# Altium project LED_grow_panel.PrjPcb
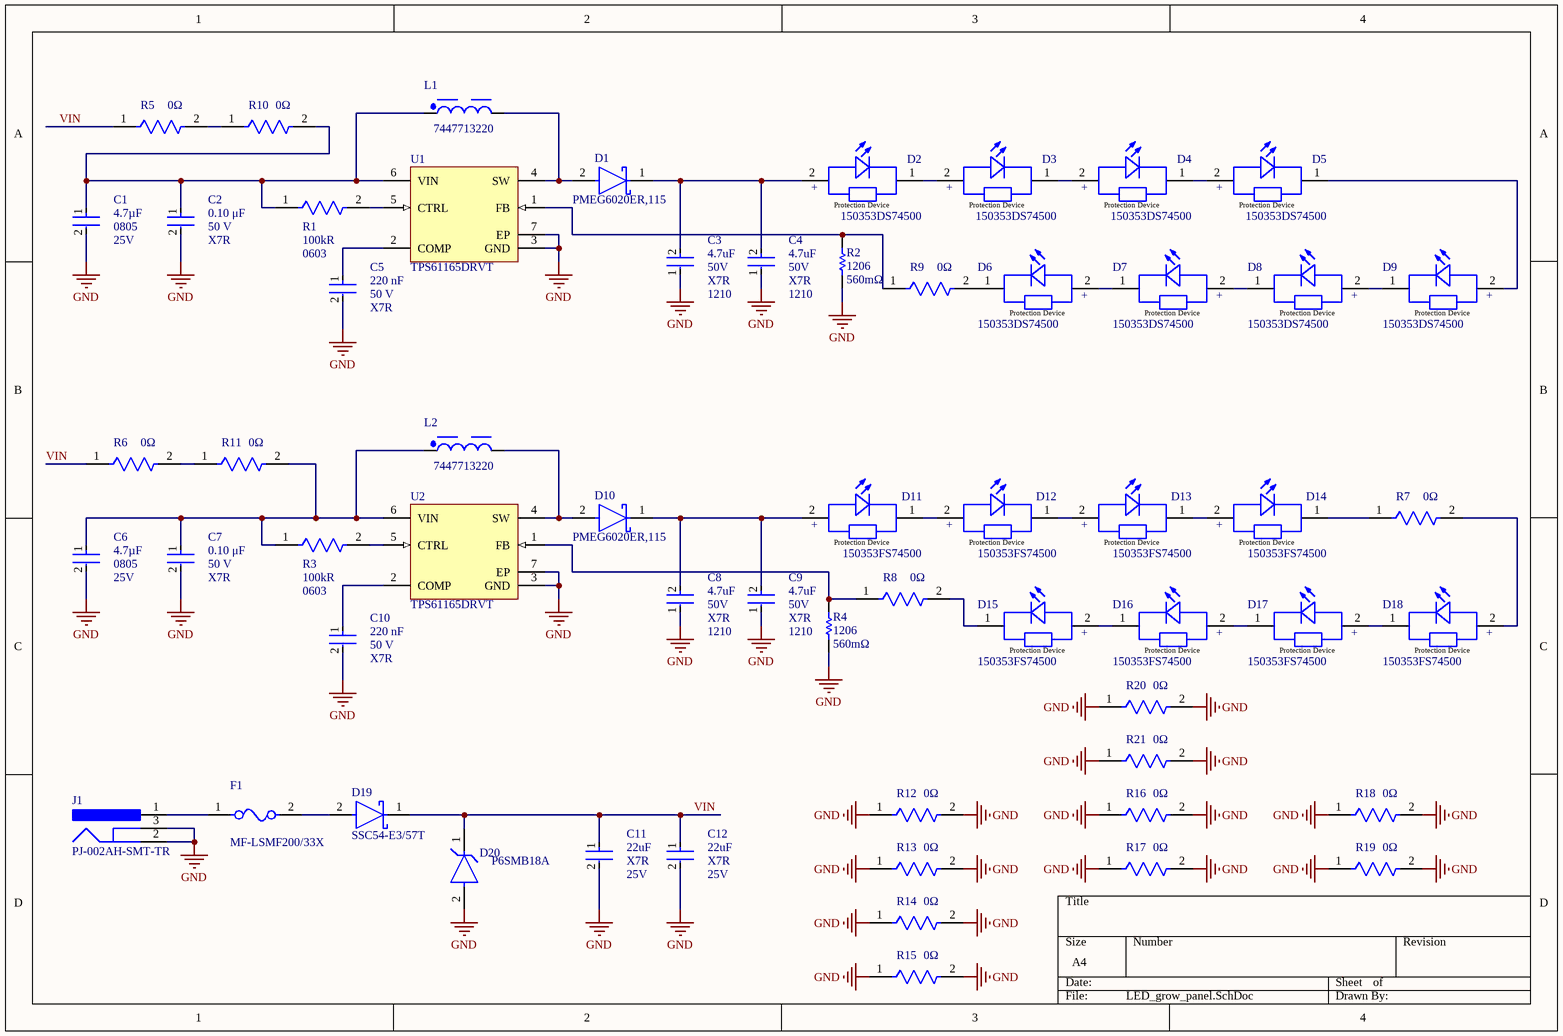
[diagram p0: LED_grow_panel.SchDoc]
1 sheet, 59 parts. Net scope: global (net labels, ports and power ports of the same name join across sheets).
Board file: LED_grow_panel.PcbDoc

## Sheet LED_grow_panel.SchDoc
size A4; SheetNumber: 1; SheetTotal: 1

### Parts
C1  value 4.7µF  Case/Package: 0805  Voltage Rating: 25V  [FP-GRM21B-0_2-e0_2_0_7-IPC_B]  (hidden comment: GRM21BZ71E475KE15L)
C2  Voltage Rating: 50 V  Capacitance: 0.10 μF  Temperature Characteristic: X7R  [FP-C0603C-CF-IPC_B]  (hidden comment: C0603C104K5RACTU)
C3  Capacitance: 4.7uF  Case Code (Imperial): 1210  Dielectric: X7R  Voltage Rating (DC): 50V  [FP-GCM32E-0_3-IPC_B]  (hidden comment: GCM32ER71H475KA55K)
C4  Capacitance: 4.7uF  Case Code (Imperial): 1210  Dielectric: X7R  Voltage Rating (DC): 50V  [FP-GCM32E-0_3-IPC_B]  (hidden comment: GCM32ER71H475KA55K)
C5  value 220 nF  Voltage: 50 V  Temperature Characteristic: X7R  [FP-CC0603-DA-IPC_B]  (hidden comment: CC0603KRX7R9BB224)
C6  value 4.7µF  Case/Package: 0805  Voltage Rating: 25V  [FP-GRM21B-0_2-e0_2_0_7-IPC_B]  (hidden comment: GRM21BZ71E475KE15L)
C7  Voltage Rating: 50 V  Capacitance: 0.10 μF  Temperature Characteristic: X7R  [FP-C0603C-CF-IPC_B]  (hidden comment: C0603C104K5RACTU)
C8  Capacitance: 4.7uF  Case Code (Imperial): 1210  Dielectric: X7R  Voltage Rating (DC): 50V  [FP-GCM32E-0_3-IPC_B]  (hidden comment: GCM32ER71H475KA55K)
C9  Capacitance: 4.7uF  Case Code (Imperial): 1210  Dielectric: X7R  Voltage Rating (DC): 50V  [FP-GCM32E-0_3-IPC_B]  (hidden comment: GCM32ER71H475KA55K)
C10  value 220 nF  Voltage: 50 V  Temperature Characteristic: X7R  [FP-CC0603-DA-IPC_B]  (hidden comment: CC0603KRX7R9BB224)
C11  value 22uF  Temperature Characteristic: X7R  Voltage Rating: 25V  [FP-C1210C226K3RACTU-IPC_B]  (hidden comment: C1210C226K3RACTU)
C12  value 22uF  Temperature Characteristic: X7R  Voltage Rating: 25V  [FP-C1210C226K3RACTU-IPC_B]  (hidden comment: C1210C226K3RACTU)
D1  PMEG6020ER,115  [FP-SOD123W-MFG]
D2  150353DS74500  [WL-SMDC_3535]
D3  150353DS74500  [WL-SMDC_3535]
D4  150353DS74500  [WL-SMDC_3535]
D5  150353DS74500  [WL-SMDC_3535]
D6  150353DS74500  [WL-SMDC_3535]
D7  150353DS74500  [WL-SMDC_3535]
D8  150353DS74500  [WL-SMDC_3535]
D9  150353DS74500  [WL-SMDC_3535]
D10  PMEG6020ER,115  [FP-SOD123W-MFG]
D11  150353FS74500  [WL-SMDC_3535]
D12  150353FS74500  [WL-SMDC_3535]
D13  150353FS74500  [WL-SMDC_3535]
D14  150353FS74500  [WL-SMDC_3535]
D15  150353FS74500  [WL-SMDC_3535]
D16  150353FS74500  [WL-SMDC_3535]
D17  150353FS74500  [WL-SMDC_3535]
D18  150353FS74500  [WL-SMDC_3535]
D19  SSC54-E3/57T  [FP-95402-MFG]
D20  P6SMB18A  [FP-P6SMB-MFG]
F1  MF-LSMF200/33X  [FP-MF-LSMF-MFG]
J1  PJ-002AH-SMT-TR  [CUI-PJ-002AH-4_V]
L1  7447713220  [WE-PD_1030P]
L2  7447713220  [WE-PD_1030P]
R1  Resistance: 100kR  Case Code (Imperial): 0603  [FP-RC0603-0_55-IPC_B]  (hidden comment: RC0603FR-07100KL)
R2  value 560mΩ  Case/Package: 1206  [RESC3216X70X50NL05T20]  (hidden comment: ERJ8BQFR56V)
R3  Resistance: 100kR  Case Code (Imperial): 0603  [FP-RC0603-0_55-IPC_B]  (hidden comment: RC0603FR-07100KL)
R4  value 560mΩ  Case/Package: 1206  [RESC3216X70X50NL05T20]  (hidden comment: ERJ8BQFR56V)
R5  value 0Ω  [FP-RC1206-IPC_B]  (hidden comment: RC1206JR-070RL)
R6  value 0Ω  [FP-RC1206-IPC_B]  (hidden comment: RC1206JR-070RL)
R7  value 0Ω  [FP-RC1206-IPC_B]  (hidden comment: RC1206JR-070RL)
R8  value 0Ω  [FP-RC1206-IPC_B]  (hidden comment: RC1206JR-070RL)
R9  value 0Ω  [FP-RC1206-IPC_B]  (hidden comment: RC1206JR-070RL)
R10  value 0Ω  [FP-RC1206-IPC_B]  (hidden comment: RC1206JR-070RL)
R11  value 0Ω  [FP-RC1206-IPC_B]  (hidden comment: RC1206JR-070RL)
R12  value 0Ω  [FP-RC1206-IPC_B]  (hidden comment: RC1206JR-070RL)
R13  value 0Ω  [FP-RC1206-IPC_B]  (hidden comment: RC1206JR-070RL)
R14  value 0Ω  [FP-RC1206-IPC_B]  (hidden comment: RC1206JR-070RL)
R15  value 0Ω  [FP-RC1206-IPC_B]  (hidden comment: RC1206JR-070RL)
R16  value 0Ω  [FP-RC1206-IPC_B]  (hidden comment: RC1206JR-070RL)
R17  value 0Ω  [FP-RC1206-IPC_B]  (hidden comment: RC1206JR-070RL)
R18  value 0Ω  [FP-RC1206-IPC_B]  (hidden comment: RC1206JR-070RL)
R19  value 0Ω  [FP-RC1206-IPC_B]  (hidden comment: RC1206JR-070RL)
R20  value 0Ω  [FP-RC1206-IPC_B]  (hidden comment: RC1206JR-070RL)
R21  value 0Ω  [FP-RC1206-IPC_B]  (hidden comment: RC1206JR-070RL)
U1  TPS61165DRVT  [DRV0006A_V]
U2  TPS61165DRVT  [DRV0006A_V]

### Nets
GND: C1.2 C2.2 C3.1 C4.1 C5.2 C6.2 C7.2 C8.1 C9.1 C10.2 C11.2 C12.2 D20.2(A) J1.2 J1.3 R2.1 R4.1 R12.1 R12.2 R13.1 R13.2 R14.1 R14.2 R15.1 R15.2 R16.1 R16.2 R17.1 R17.2 R18.1 R18.2 R19.1 R19.2 R20.1 R20.2 R21.1 R21.2 U1.3(GND) U1.7(EP) U2.3(GND) U2.7(EP)
VIN: C11.1 C12.1 D19.1(C) D20.1(C) R5.1 R6.1
NetC1_1: C1.1 C2.1 L1.1 R1.1 R10.2 U1.6(VIN)
NetC3_2: C3.2 C4.2 D1.1(C) D2.2(A)
NetC5_1: C5.1 U1.2(COMP)
NetC6_1: C6.1 C7.1 L2.1 R3.1 R11.2 U2.6(VIN)
NetC8_2: C8.2 C9.2 D10.1(C) D11.2(A)
NetC10_1: C10.1 U2.2(COMP)
NetD1_2: D1.2(A) L1.2 U1.4(SW)
NetD2_1: D2.1(K) D3.2(A)
NetD3_1: D3.1(K) D4.2(A)
NetD4_1: D4.1(K) D5.2(A)
NetD5_1: D5.1(K) D9.2(A)
NetD6_1: D6.1(K) R9.2
NetD6_2: D6.2(A) D7.1(K)
NetD7_2: D7.2(A) D8.1(K)
NetD8_2: D8.2(A) D9.1(K)
NetD10_2: D10.2(A) L2.2 U2.4(SW)
NetD11_1: D11.1(K) D12.2(A)
NetD12_1: D12.1(K) D13.2(A)
NetD13_1: D13.1(K) D14.2(A)
NetD14_1: D14.1(K) R7.1
NetD15_1: D15.1(K) R8.2
NetD15_2: D15.2(A) D16.1(K)
NetD16_2: D16.2(A) D17.1(K)
NetD17_2: D17.2(A) D18.1(K)
NetD18_2: D18.2(A) R7.2
NetD19_2: D19.2(A) F1.2
NetF1_1: F1.1 J1.1
NetR1_2: R1.2 U1.5(CTRL)
NetR2_2: R2.2 R9.1 U1.1(FB)
NetR3_2: R3.2 U2.5(CTRL)
NetR4_2: R4.2 R8.1 U2.1(FB)
NetR5_2: R5.2 R10.1
NetR6_2: R6.2 R11.1

### Notes on the sheet
- (in symbol CMP-03913-90235581-2) +; Protection Device
- (in symbol CMP-03913-90235582-2) +; Protection Device

### Library data of the parts
C1 C6 = CMP-06035-039079-1: Chip Multilayer Ceramic Capacitors for General Purpose, 0805, 4.7uF, X7R, 15%, 10%, 25V; Manufacturer: Murata; Manufacturer Lifecycle Status: IN PRODUCTION; Supplier: DigiKey; Supplier Part Number: 490-GRM21BZ71E475KE15LCT-ND; Manufacturer Part Number: GRM21BZ71E475KE15L; RoHS: Compliant; Category: Ceramic Capacitors; Stock: 127456; Pricing: 1=0,28, 10=0,164, 50=0,1184, 100=0,1046, 500=0,08132, 1000=0,07413 (USD); Dielectric Material: Ceramic; Export Control Classification Number (ECCN) Code: EAR99; Height: 1.25mm; Harmonized Tariff Schedule (HTS) Code: 8532.24.00.20; Introduction Date: 2017-02-22; Length: 2mm; Lifecycle Status: Production; Material: Ceramic; Max Operating Temperature: 125°C; Min Operating Temperature: -55°C; Mounting Technology: Surface Mount; Number of Terminals: 2; REACH SVHC: Yes; Thickness: 1.25mm; Tolerance: 10%; Voltage Rating (DC): 25V; Width: 1.25mm; ComponentLink1URL: https://datasheet.octopart.com:443/GRM21BZ71E475KE15L-Murata-datasheet-155345087.pdf?src-supplier=Newark; ComponentLink1Description: https://datasheet.octopart.com:443/GRM21BZ71E475KE15L-Murata-datasheet-155345087.pdf?src-supplier=Newark; ComponentLink2URL: https://datasheet.octopart.com:443/GRM21BZ71E475KE15L-Murata-datasheet-141278877.pdf?src-supplier=Geoflip; ComponentLink2Description: https://datasheet.octopart.com:443/GRM21BZ71E475KE15L-Murata-datasheet-141278877.pdf?src-supplier=Geoflip; ComponentLink3URL: https://datasheet.octopart.com:443/GRM21BZ71E475KE15L-Murata-datasheet-165579666.pdf?src-supplier=TME; ComponentLink3Description: https://datasheet.octopart.com:443/GRM21BZ71E475KE15L-Murata-datasheet-165579666.pdf?src-supplier=TME; ComponentLink4URL: https://datasheet.octopart.com:443/GRM21BZ71E475KE15L-Murata-datasheet-140707839.pdf?src-supplier=Ciiva; ComponentLink4Description: https://datasheet.octopart.com:443/GRM21BZ71E475KE15L-Murata-datasheet-140707839.pdf?src-supplier=Ciiva; ComponentLink5URL: https://datasheet.octopart.com:443/GRM21BZ71E475KE15L-Murata-datasheet-138745135.pdf?src-supplier=Ciiva; ComponentLink5Description: https://datasheet.octopart.com:443/GRM21BZ71E475KE15L-Murata-datasheet-138745135.pdf?src-supplier=Ciiva; ComponentLink6URL: http://sigma.octopart.com:80/reach_statement/Murata-company-16.pdf?src-supplier=Compliance+Statements; ComponentLink6Description: http://sigma.octopart.com:80/reach_statement/Murata-company-16.pdf?src-supplier=Compliance+Statements
C2 C7 = CMP-2006-03061-2: CAP CER 0.1UF 50V X7R 0603; Manufacturer: KEMET; Tolerance: 0.1; Temperature Coefficient: 30ppm/°C; Material: Ceramic; Automotive Grade: Grade 1; Value: 0.10 μF; Temperature: -55°C to +125°C; RoHS: TRUE; Temperature Range High: +125°C; Lead Free: Yes; Octopart: https://octopart.com/c0603c104k5ractu-kemet-139244; Digikey Description: CAP CER 0.1UF 50V X7R 0603; Category: Cap; Package: C0603C-CF; ComponentLink2Description: Datasheet; Temperature Range Low: -55°C; Device Class L1: Passive Components; Automotive: Yes; Device Class L3: Ceramic Capacitors; ComponentLink2URL: https://api.kemet.com/component-edge/download/datasheet/C0603C100J5GACAUTO.pdf; Device Class L2: Capacitors; Manufacturer Part Number: C0603C104K5RACTU; Height: 0.87mm
C3 C4 C8 C9 = CMP-06035-058874-1: Ceramic Capacitor for Automotive 4.7uF ±10% 50VDC X7R 1210 Embossed T/R; Mount: Surface Mount; Termination: SMD/SMT; Tolerance: 10%; Packaging: Tape and Reel; Min Operating Temperature: -55°C; Max Operating Temperature: 125°C; Radiation Hardening: No; Width: 0.098inch; Case/Package: 1210; Length: 3.2mm; Height: 2.5mm; Thickness: 0.106inch; Ratings: AEC-Q200; Depth: 2.5mm; Voltage Rating: 50V; Case Code (Metric): 3225; Package Quantity: 1
C5 C10 = CMP-03422-001373-1: 0.22µF 50V Ceramic Capacitor X7R 0603 (1608 Metric) 0.063" L x 0.031" W (1.60mm x 0.80mm); Manufacturer: YAGEO; Tolerance: 0.1; Temperature Coefficient: 15%; ComponentLink2URL: http://www.yageo.com/documents/recent/UPY-GPHC_X7R_6.3V-to-50V_18.pdf; Temperature Range High: +125°C; Lead Free: Yes; Mouser Description: 0603 50 V 0.22 uF ±10% Tolerance X7R Multilayer Ceramic Capacitor; Material: Ceramic; Temperature Range Low: -55°C; Manufacturer Part Number: CC0603KRX7R9BB224; Digikey Description: 0.22µF 50V Ceramic Capacitor X7R 0603 (1608 Metric) 0.063" L x 0.031" W (1.60mm x 0.80mm); Device Class L3: Ceramic Capacitors; RoHS: TRUE; Octopart: https://octopart.com/cc0603krx7r9bb224-yageo-30314039; Package: CC0603-DA; Device Class L1: Passive Components; Automotive: No; Height: 0.9mm; Device Class L2: Capacitors; Voltage Rating: 50 V; Temperature: -55°C to +125°C; Footprint Url: http://www.yageo.com/exep/pages/download/literatures/UPY-C_GEN_24.pdf; Category: Cap; Capacitance: 220 nF; ComponentLink2Description: Datasheet
C11 C12 = CMP-03020-016899-1: CAP CER 22UF 25V X7R 1210; Manufacturer: KEMET; Temperature Coefficient: 15%; Material: Ceramic; Tolerance: 10%; Category: Cap; Package: C1210C226K3RACTU; ComponentLink2Description: Datasheet; Device Class L1: Passive Components; Temperature: -55°C to +125°C; Ipc Land Pattern Name: CAPC320250X250; Octopart: https://octopart.com/c1210c226k3ractu-kemet-56838491; ComponentLink2URL: https://content.kemet.com/datasheets/KEM_C1002_X7R_SMD.pdf; Device Class L2: Capacitors; Temperature Range Low: -55°C; Device Class L3: Ceramic Capacitors; Mouser Description: 1210 C1210C 22uF Ceramic Multilayer Capacitor, 25V dc, +125C, X7R Dielectric, +/-10%; Automotive: No; Capacitance: 22uF; Temperature Range High: +125°C; Manufacturer Part Number: C1210C226K3RACTU; Digikey Description: CAP CER 22UF 25V X7R 1210; Lead Free: Yes; RoHS: TRUE; Height: 2.8mm
D1 D10 = CMP-14398-000024-1: DIODE SCHOTTKY 60V 2A SOD123W; RoHS Compliant: Yes
D2-D9 = CMP-03913-90235581-2: WL-SMDC SMT Mono-color Ceramic LED Waterclear Hort; Manufacturer Lifecycle Status: ACTIVE; Manufacturer: Wurth Elektronik; Peak Wavelength: 450nm; YEOL: 1 = Estimated lifetime > 10 years; Viewing Angle: 125°; Forward Voltage: 3.2V; Max Reverse Voltage (DC): 5V; Forward Current: 1.5A; RoHS: Compliant; Packaging: Tape and Reel; Wavelength: 450nm; Lifecycle Status: Production; Height: 2.1mm; Max Operating Temperature: 100°C; Length: 3.4mm; Width: 3.4mm; Min Operating Temperature: -40°C; Supplier: DigiKey; Supplier Part Number: 732-12002-1-ND; Manufacturer Part Number: 150353DS74500; Category: LEDs; Stock: 694; Pricing: 1=3,93, 10=3,631, 100=3,334, 500=2,594 (USD); ComponentLink1URL: https://datasheet.octopart.com:443/150353DS74500-Wurth-Elektronik-datasheet-168474468.pdf?src-supplier=Newark; ComponentLink1Description: https://datasheet.octopart.com:443/150353DS74500-Wurth-Elektronik-datasheet-168474468.pdf?src-supplier=Newark
D11-D18 = CMP-03913-90235582-2: WL-SMDC SMT Mono-color Ceramic LED Waterclear Hort; Manufacturer Lifecycle Status: ACTIVE; Manufacturer: Wurth Elektronik; YEOL: 1 = Estimated lifetime > 10 years; Wavelength: 730nm; Forward Voltage: 1.8V; Viewing Angle: 125°; Max Reverse Voltage (DC): 5V; Forward Current: 1.5A; Min Operating Temperature: -40°C; Length: 3.4mm; Max Operating Temperature: 100°C; Lifecycle Status: Production; Height: 2.1mm; RoHS: Compliant; Packaging: Tape and Reel; Width: 3.4mm; Peak Wavelength: 730nm; Supplier: DigiKey; Supplier Part Number: 732-12003-1-ND; Manufacturer Part Number: 150353FS74500; Category: Optoelectronics; Stock: 580; Pricing: 1=6,48, 10=5,987, 100=5,499, 500=4,278 (USD); ComponentLink1URL: https://datasheet.octopart.com:443/150353FS74500-Wurth-Elektronik-datasheet-168474492.pdf?src-supplier=Newark; ComponentLink1Description: https://datasheet.octopart.com:443/150353FS74500-Wurth-Elektronik-datasheet-168474492.pdf?src-supplier=Newark
D19 = CMP-02539-000015-1: DIODE SCHOTTKY 40V 5A DO214AB; Manufacturer: Vishay; Max Surge Forward Current: 175A; Max Junction Temp: +150°C; Peak Reverse Current: 0.5mA; Standoff Height: 0mm; Manufacturer Part Number: SSC54-E3/57T; Octopart: https://octopart.com/ssc54-e3%2F57t-vishay-39552944; Footprint Url: https://www.vishay.com/docs/95402/smc.pdf; Temperature Range Low: -65°C; RoHS: TRUE; Device Class L3: Schottky Diodes; Temperature: -65°C to +150°C; ComponentLink2URL: http://www.vishay.com/docs/88885/ssc53l.pdf; Device Class L2: Diodes; Device Class L1: Discrete Semiconductors; Reverse Voltage: 40V; Forward Current: 5A; Category: Diode; Height: 2.62mm; Automotive: No; Package: 95402; Max Repetitive Reverse Voltage: 40V; Lead Free: Yes; ComponentLink2Description: Datasheet; Temperature Range High: +150°C; Digikey Description: DIODE SCHOTTKY 40V 5A DO214AB; Mouser Description: SSC54 Series 40 V 5 A Surface Mount Schottky Rectifier - DO-214AB
D20 = CMP-08607-000078-1: TVS DIODE 15.3V 25.5V DO214AA; Manufacturer: Littelfuse Inc; Peak Pulse Power: 600W; Direction: Unidirectional; Peak Pulse Current: 24.2A; Breakdown Voltage: 17.1V; Number Of Channels: 1; Max Junction Temp: +150°C; Temperature Range Low: -65°C; Clamping Voltage: 25.5V; Temperature Range High: +150°C; Height: 2.61mm; Device Class L2: TVS Diodes; Octopart: https://octopart.com/p6smb18a-littelfuse-8918162; Digikey Description: TVS DIODE 15.3V 25.5V DO214AA; Reverse Standoff Voltage: 15.3V; Temperature: -65°C to +150°C; Automotive: No; ComponentLink2URL: https://www.littelfuse.com/~/media/electronics/datasheets/tvs_diodes/littelfuse_tvs_diode_p6smb_datasheet.pdf.pdf; RoHS: TRUE; Category: Diode; Mouser Description: P6SMB Series 15.3 V 600 W Surface Mount Uni-Directional TVS Diode - DO-214AA; Device Class L3: unset; ComponentLink2Description: Datasheet; Manufacturer Part Number: P6SMB18A; Package: P6SMB; Device Class L1: Circuit Protection; Lead Free: Yes
F1 = CMP-07400-000015-1: PTC RESET FUSE 33V 2A 2920; Manufacturer: Bourns; Current Rating: 40A; Automotive Grade: Grade 3; Resistance: 0.045-0.15Ω; Value: 0.045-0.15Ω; Trip Current: 3.7A; Trip Time: 2.5s; Hold Current: 1.85A; Manufacturer Part Number: MF-LSMF200/33X; Category: Fuse; Octopart: https://octopart.com/mf-lsmf185%2F33x-2-bourns-19504849; RoHS: TRUE; Digikey Description: PTC RESET FUSE 33V 1.85A 2920; Lead Free: Yes; Voltage Rating: 33V; ComponentLink2URL: https://www.bourns.com/docs/Product-Datasheets/mflsmf.pdf; Package: MF-LSMF; ComponentLink2Description: Datasheet; Mouser Description: Resettable Fuses - PPTC 1.85A 33V 0.045ohm SMD 2920; Device Class L2: PTC Resettable Fuses; Temperature Range High: +85°C; Temperature Range Low: -40°C; Device Class L1: Circuit Protection; Device Class L3: unset; Height: 1.6mm; Automotive: Yes; Temperature: -40°C to +85°C
J1 = CMP-2000-06896-2: DC Power Jack, Right Angle, -25 to 85 degC, 4-Pin 14.8 x 9 x 11 mm SMD, RoHS, Tape and Reel; Manufacturer: CUIInc.; Brand: CUI; Inside Contact Diameter: 2mm; Voltage Rating: 24V; Insulation Resistance: 100MOhms; Outside Contact Diameter: 6.5mm; Current Rating: 5A; Mounting Angle: Right; Contact Plating: Nickel; Package Description: 4-Pin Surface Mount Device, Body 14.8 x 9 mm, Pitch 6.1 mm; Factory Pack Quantity: 350; Datasheet Version: Rev. 1.03, 11/2012; Operating Temperature Range: -25Cto+85C; Termination Style: SMD/SMT; Product: Jacks; Contact Gender: Male; Product Category: DCPowerConnectors; RoHS: True; Connector Type: DCPowerJack; Packaging: Reel; Contact Material: Brass; Flammability Rating: UL94V-0; Datasheet URL: http://www.cui.com/product/resource/pj-002ah-smt.pdf; Package Reference: PJ-002AH; Manufacturer URL: http://www.cui.com/; PartNumber: PJ-002AH; Mounting Style: SMD/SMT; Mounting Technology: SurfaceMount; Housing Material: Polyamide(PA)
L1 L2 = CMP-1396-00012-3: WE-PD Performance SMT Shielded Power Inductor; DC Resistance (DCR): 111mΩ; Inductance Tolerance: 20%; Current Rating: 1.7A; Inductance: 22µH; Self Resonant Frequency: 17.5MHz; Height: 3mm; Ambient Temperature Range High: 110°C; Number of Pins: 2; Length: 10mm; Ambient Temperature Range Low: -40°C; RoHS: Compliant; Width: 10mm; Min Operating Temperature: -40°C; Max Operating Temperature: 150°C
R1 R3 = CMP-2100-03662-2: RES SMD 100K OHM 1% 1/10W 0603; Voltage Rating (DC): 50V; Max Power Dissipation: 100mW; Temperature Coefficient: 100ppm/°C; Working Voltage: 75V; Length: 1.6mm; Lead Free: Lead Free; Number of Terminations: 2; Packaging: Tape and Reel; Voltage Rating: 50V; Termination: SMD/SMT; Width: 0.8mm; Resistor Type: Thick Film; Resistance Tolerance: 1%; Features: Moisture Resistant; Height: 0.45mm; Construction: Rectangular; Case/Package: 0603; Military Standard: Not; Series: RC; Technology: THICK FILM; Depth: 0.8mm; RoHS Compliant: Yes; REACH SVHC: No SVHC; Min Operating Temperature: -55°C; Case Code (Metric): 1608; Max Operating Temperature: 155°C; Power Rating: 100mW; Number of Pins: 2; Tolerance: 1%
R2 R4 = CMP-2003-00756-1: Manufacturer: Panasonic; Manufacturer Lifecycle Status: ACTIVE; Part Series: Current Sensing Resistors Thick Film Type; Max Power Dissipation: 500mW; Temperature Coefficient: 250ppm/°C; Tolerance: 1%; Working Voltage: 529.2mV; Part Number: ERJ8BQFR56V; Supplier: DigiKey; Supplier Part Number: P17251CT-ND; Manufacturer Part Number: ERJ8BQFR56V; RoHS: Compliant; Category: Chip SMD Resistors; Stock: 1597; Pricing: 1=0,29, 10=0,153, 25=0,1236, 50=0,1066, 100=0,0932, 250=0,07976, 500=0,072, 1000=0,06585 (USD); Case Code (Imperial): 1206; Case Code (Metric): 3216; Composition: Thick Film; Contact Plating: Tin; Country of Origin: Japan; Depth: 1.6mm; Export Control Classification Number (ECCN) Code: EAR99; Features: Automotive AEC-Q200; Height: 600µm; Harmonized Tariff Schedule (HTS) Code: 8533.21.00.30; Introduction Date: 2009-12-28; Length: 3.2mm; Lifecycle Status: Production; Max Operating Temperature: 155°C; Military Standard: Not; Min Operating Temperature: -55°C; Mounting Technology: Surface Mount; Pins: 2; Number of Terminals: 2; Number of Terminations: 2; Packaging: Cut Tape; Power Rating: 500mW; Radiation Hardening: No; Ratings: AEC-Q200; REACH SVHC: Yes; Schedule B: 8533210045; Termination: SMD/SMT; Width: 1.6mm; ComponentLink1URL: https://datasheet.octopart.com:443/ERJ8BQFR56V-Panasonic-datasheet-175421125.pdf?src-supplier=IHS; ComponentLink1Description: https://datasheet.octopart.com:443/ERJ8BQFR56V-Panasonic-datasheet-175421125.pdf?src-supplier=IHS; ComponentLink2URL: https://datasheet.octopart.com:443/ERJ8BQFR56V-Panasonic-datasheet-68299093.pdf?src-supplier=Future+Electronics; ComponentLink2Description: https://datasheet.octopart.com:443/ERJ8BQFR56V-Panasonic-datasheet-68299093.pdf?src-supplier=Future+Electronics; ComponentLink3URL: https://datasheet.octopart.com:443/ERJ8BQFR56V-Panasonic-datasheet-159764274.pdf?src-supplier=Farnell; ComponentLink3Description: https://datasheet.octopart.com:443/ERJ8BQFR56V-Panasonic-datasheet-159764274.pdf?src-supplier=Farnell; ComponentLink4URL: https://datasheet.octopart.com:443/ERJ8BQFR56V-Panasonic-datasheet-15994758.pdf?src-supplier=Farnell; ComponentLink4Description: https://datasheet.octopart.com:443/ERJ8BQFR56V-Panasonic-datasheet-15994758.pdf?src-supplier=Farnell; ComponentLink5URL: https://datasheet.octopart.com:443/ERJ-8BQFR56V-Panasonic-datasheet-154766170.pdf?src-supplier=JRH+Electronics; ComponentLink5Description: https://datasheet.octopart.com:443/ERJ-8BQFR56V-Panasonic-datasheet-154766170.pdf?src-supplier=JRH+Electronics; ComponentLink6URL: https://datasheet.octopart.com:443/ERJ8BQFR56V-Panasonic-datasheet-5317253.pdf?src-supplier=RS+(Formerly+Allied+Electronics); ComponentLink6Description: https://datasheet.octopart.com:443/ERJ8BQFR56V-Panasonic-datasheet-5317253.pdf?src-supplier=RS+(Formerly+Allied+Electronics); ComponentLink7URL: https://datasheet.octopart.com:443/ERJ8BQFR56V-Panasonic-datasheet-164871471.pdf?src-supplier=Burklin+Elektronik; ComponentLink7Description: https://datasheet.octopart.com:443/ERJ8BQFR56V-Panasonic-datasheet-164871471.pdf?src-supplier=Burklin+Elektronik; ComponentLink8URL: https://datasheet.octopart.com:443/ERJ8BQFR56V-Panasonic-datasheet-13271236.pdf?src-supplier=Electro+Sonic; ComponentLink8Description: https://datasheet.octopart.com:443/ERJ8BQFR56V-Panasonic-datasheet-13271236.pdf?src-supplier=Electro+Sonic; ComponentLink9URL: https://datasheet.octopart.com:443/ERJ-8BQFR56V-Panasonic-datasheet-22087634.pdf?src-supplier=Electro+Sonic; ComponentLink9Description: https://datasheet.octopart.com:443/ERJ-8BQFR56V-Panasonic-datasheet-22087634.pdf?src-supplier=Electro+Sonic
R5-R21 = CMP-2100-03681-2: RES SMD 0 OHM JUMPER 1/4W 1206; Manufacturer: YAGEO; Voltage Rating: 200V; Temperature Coefficient: 300ppm/°C; Power Rating: 0.25W; Description: 0 Ohms Jumper 0.25W, 1/4W Chip Resistor 1206 (3216 Metric) Moisture Resistant Thick Film; Tolerance: 5%; Manufacturer Part Number: RC1206JR-070RL; Temperature Range Low: -55°C; Category: Res; Automotive: No; Ipc Land Pattern Name: RESC310160X55; Device Class L1: Passive Components; Temperature: -55°C to +155°C; ComponentLink2URL: https://www.yageo.com/upload/media/product/productsearch/datasheet/rchip/PYu-RC_Group_51_RoHS_L_10.pdf; Lead Free: Yes; Height: 0.65mm; Footprint Url: https://www.yageo.com/upload/website/yageo_PYu-R_Mount_10_19050818_343.pdf; Package: RC1206; Digikey Description: RES SMD 0 OHM JUMPER 1/4W 1206; Temperature Range High: +155°C; Device Class L3: Chip SMD Resistors; Device Class L2: Resistors; Octopart: https://octopart.com/rc1206jr-070rl-yageo-40025601; Resistance: 0Ω; Series: RC; ComponentLink2Description: Datasheet; Composition: Thick Film; RoHS: TRUE; Mouser Description: Resistor: thick film; SMD; 1206; 0O; 0.25W; ±5%; -55÷155°C
U1 U2 = CMP-0388-00236-2: High Brightness White LED Driver, 3 to 18 V, -40 to 85 degC, 6-pin SON (DRV6), Green (RoHS & no Sb/Br); Manufacturer: Texas Instruments; Dimming: TRUE; Iq(Typ)(mA): 1.5; Topology: Boost; Rating: Catalog; Vin(Max)(V): 18; Switching Frequency(Max)(kHz): 1200; Vin(Min)(V): 3; PackageVersion: 4206925/E; Eco-Plan: Green (RoHS & no Sb/Br); PackageReference: DRV0006A; ComponentLink2Description: Datasheet; ComponentLink3Description: Package Specification; ComponentLink1Description: Manufacturer URL; PartNumber: TPS61165DRVT; Synchronous Rectification: TRUE; DatasheetVersion: SLVS790B; ComponentLink2URL: http://www.ti.com/general/docs/lit/getliterature.tsp?genericPartNumber=TPS61165&fileType=pdf; ComponentLink1URL: http://www.ti.com/; SubFamily: White LED Driver; ComponentLink3URL: http://www.ti.com/litv/pdf/mpds216d; Mounting Technology: Surface Mount; PackageDescription: 6-Pin Plastic Small Outline No-Lead, Body 2 x 2 mm, Pitch 0.65 mm